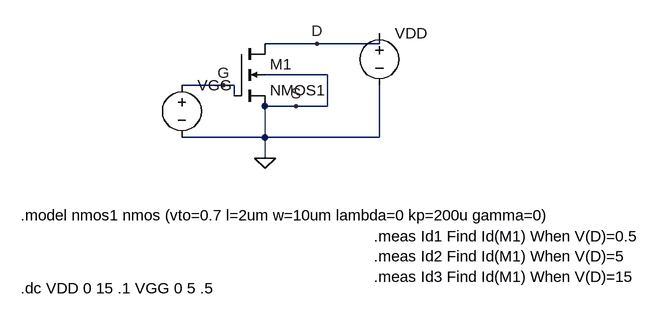
[diagram p0: schematic Mosfet1.asc]
Mosfet1.asc, the LTspice schematic file:
Version 4.1
SHEET 1 880 680
WIRE 208 80 128 80
WIRE 304 80 304 64
WIRE 304 80 208 80
WIRE 224 128 128 128
WIRE 64 144 0 144
WIRE 80 144 64 144
WIRE 80 160 80 144
WIRE 176 176 128 176
WIRE 224 176 224 128
WIRE 224 176 176 176
WIRE 128 224 128 176
WIRE 128 224 0 224
WIRE 304 224 304 144
WIRE 304 224 128 224
WIRE 128 256 128 224
FLAG 128 256 0
FLAG 64 144 G
FLAG 176 176 S
FLAG 208 80 D
SYMBOL nmos4 80 80 R0
SYMATTR InstName M1
SYMATTR Value NMOS1
SYMBOL voltage 0 128 R0
WINDOW 123 0 0 Left 0
WINDOW 39 0 0 Left 0
SYMATTR InstName VGG
SYMATTR Value ""
SYMBOL voltage 304 48 R0
WINDOW 123 0 0 Left 0
WINDOW 39 0 0 Left 0
SYMATTR InstName VDD
SYMATTR Value ""
TEXT -248 344 Left 2 !.model nmos1 nmos (vto=0.7 l=2um w=10um lambda=0 kp=200u gamma=0)
TEXT 296 376 Left 2 !.meas Id1 Find Id(M1) When V(D)=0.5\n.meas Id2 Find Id(M1) When V(D)=5\n.meas Id3 Find Id(M1) When V(D)=15
TEXT -248 456 Left 2 !.dc VDD 0 15 .1 VGG 0 5 .5

The netlist it stands for:
* Mosfet1.asc
M1 D G 0 0 NMOS1
VGG G 0
VDD D 0
.model NMOS NMOS
.model PMOS PMOS
.lib standard.mos
.model nmos1 nmos (vto=0.7 l=2um w=10um lambda=0 kp=200u gamma=0)
.meas Id1 Find Id(M1) When V(D)=0.5
.meas Id2 Find Id(M1) When V(D)=5
.meas Id3 Find Id(M1) When V(D)=15
.dc VDD 0 15 .1 VGG 0 5 .5
.backanno
.end